# Altium schematic sheet Top_Sheet.SchDoc
size A4; DocumentNumber: 1; SheetNumber: 1; SheetTotal: 2
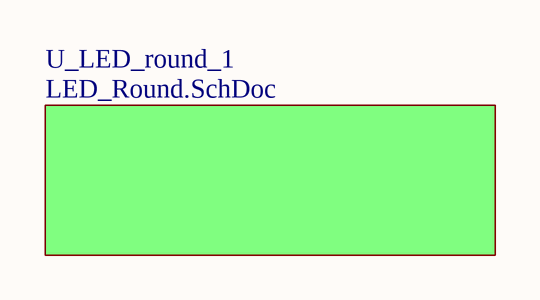
[diagram p0: Top_Sheet.SchDoc]

## Sub-sheets
U_LED_round_1 = LED_Round.SchDoc: no entries